# Altium project Side.PrjPcb
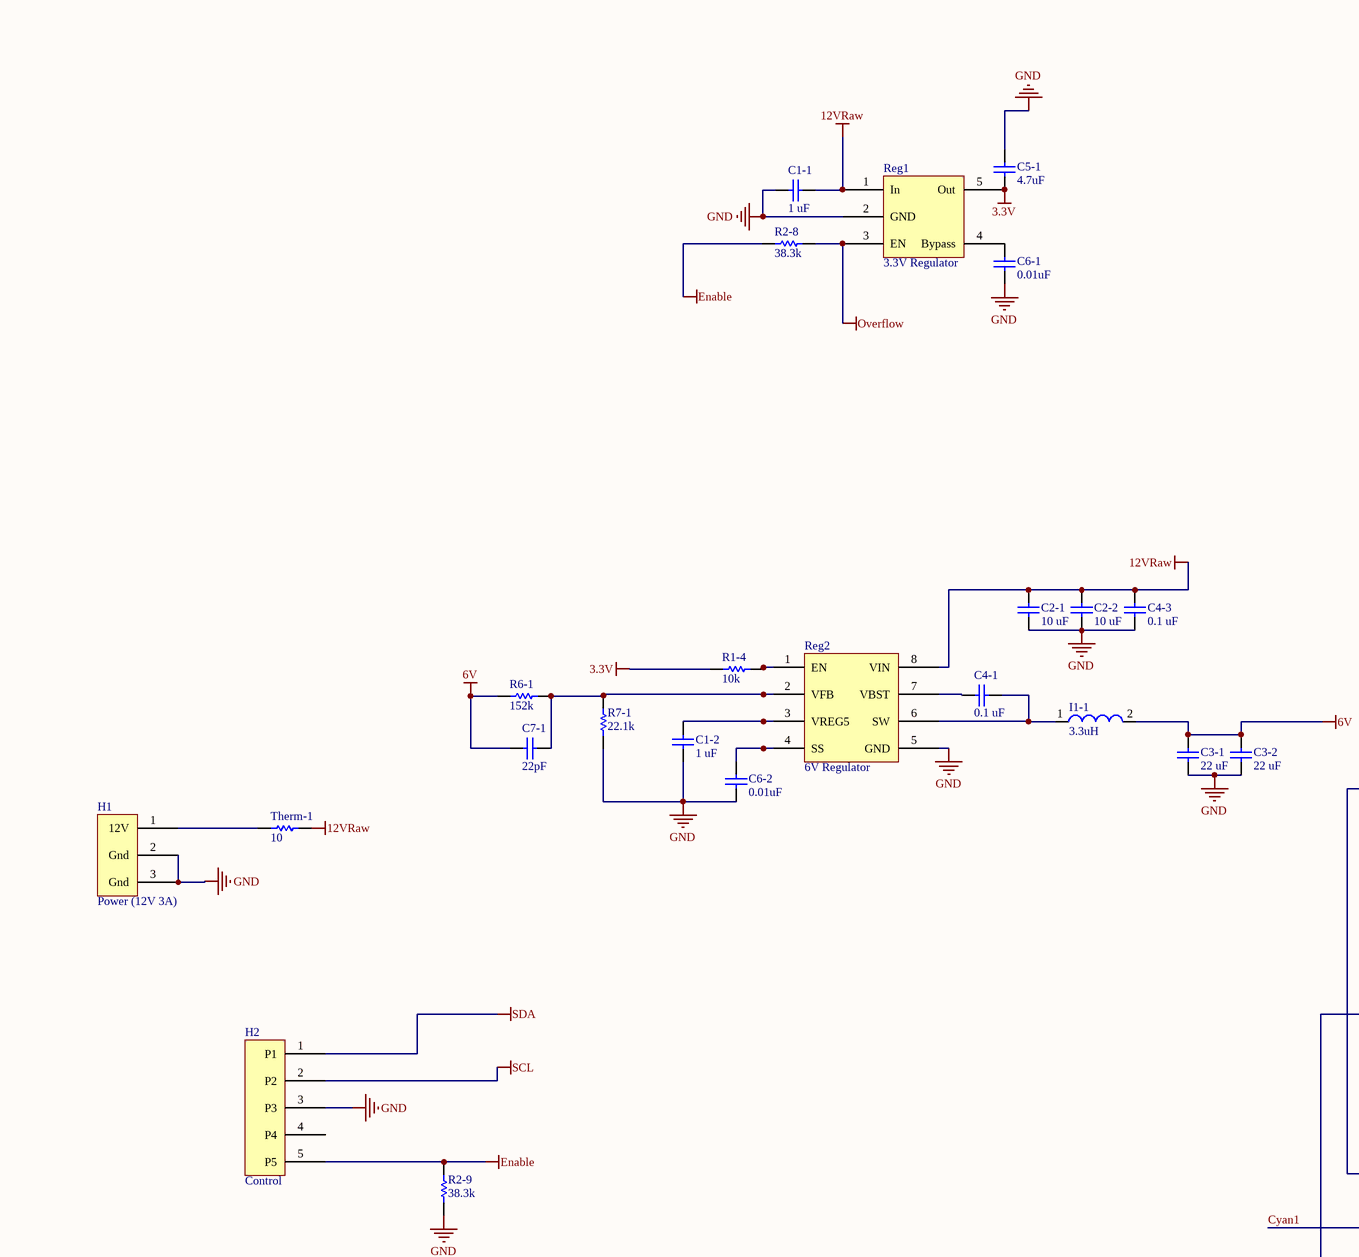
[diagram p0: Side.SchDoc, top left]
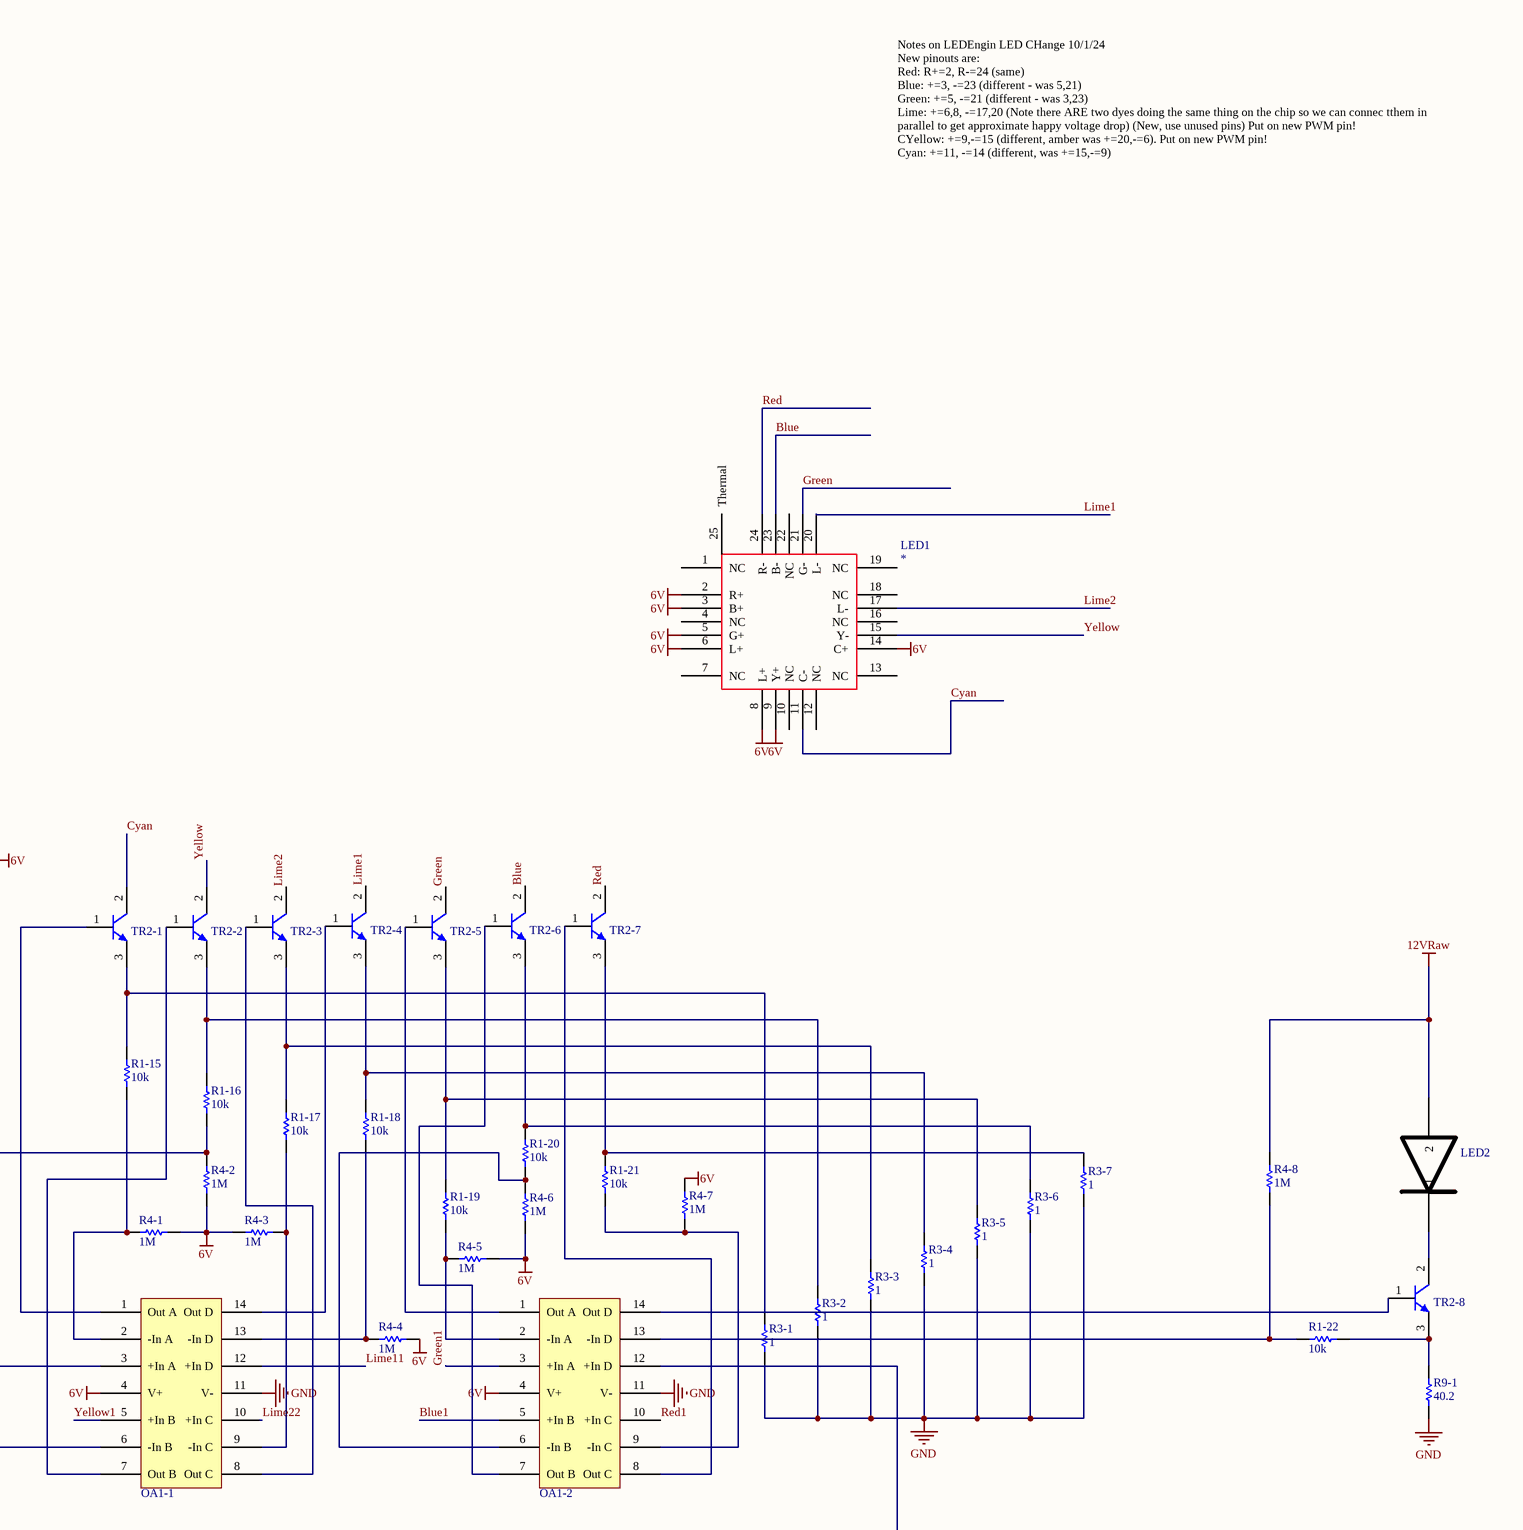
[diagram p1: Side.SchDoc, top right]
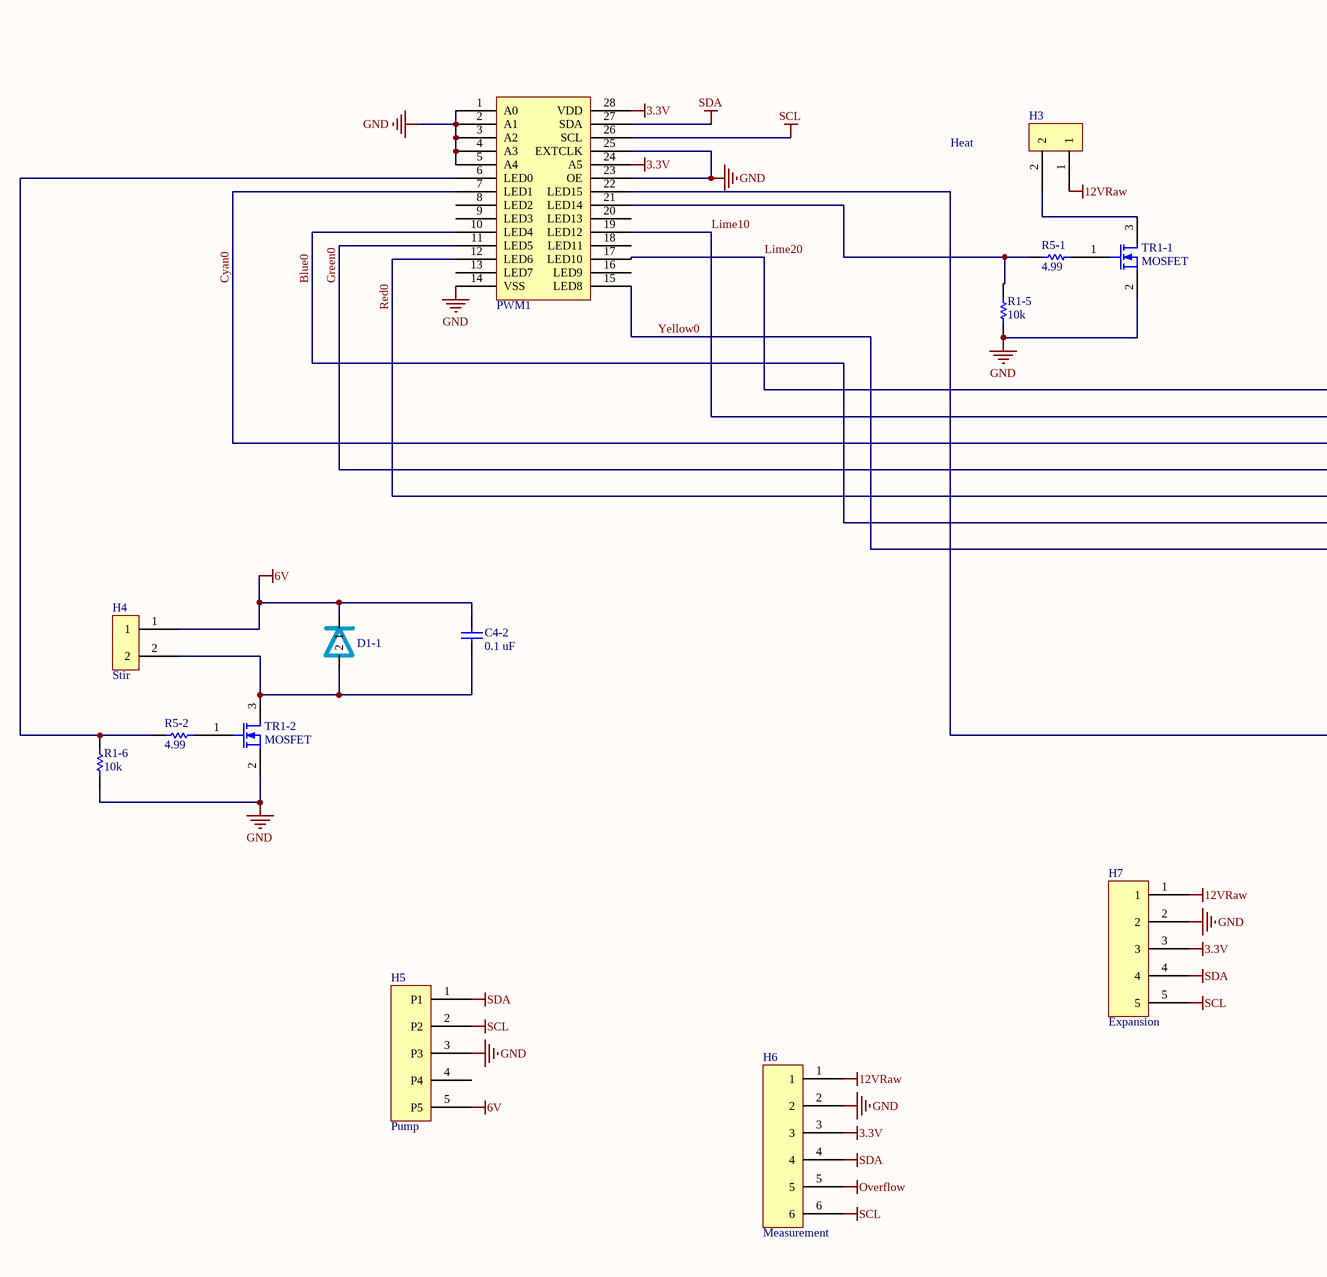
[diagram p2: Side.SchDoc, bottom left]
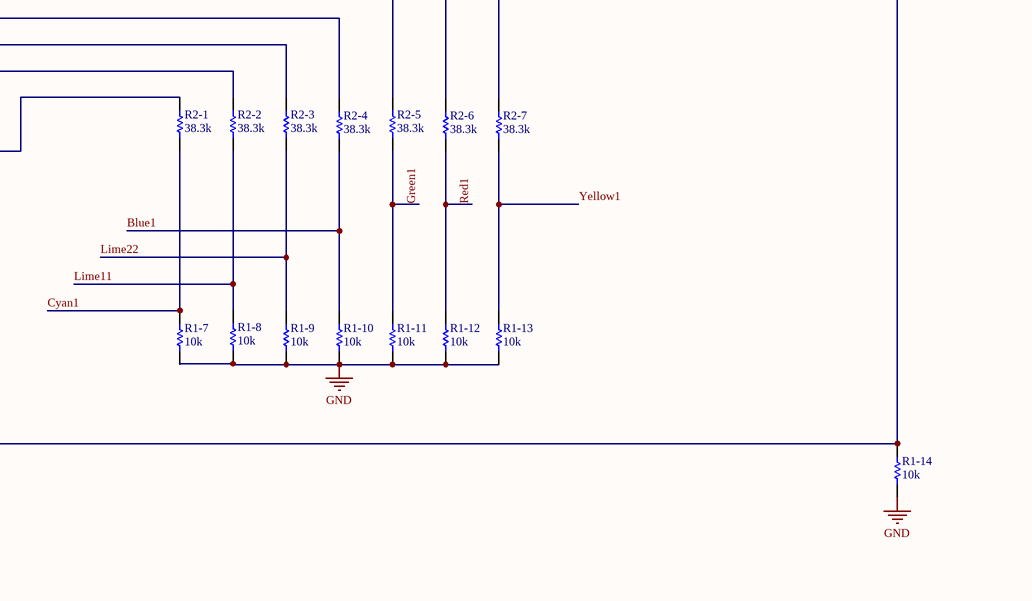
[diagram p3: Side.SchDoc, bottom right]
1 sheet, 88 parts. Net scope: global (net labels, ports and power ports of the same name join across sheets).
Board file: Side.PcbDoc

## Sheet Side.SchDoc
size A1

### Parts
C1-1  1 uF  [1608[0603]]
C1-2  1 uF  [1608[0603]]
C2-1  10 uF  [0805Large]
C2-2  10 uF  [0805Large]
C3-1  22 uF  [0805Large]
C3-2  22 uF  [0805Large]
C4-1  0.1 uF  [1608[0603]]
C4-2  0.1 uF  [1608[0603]]
C4-3  0.1 uF  [1608[0603]]
C5-1  4.7uF  [1608[0603]]
C6-1  0.01uF  [1608[0603]]
C6-2  0.01uF  [1608[0603]]
C7-1  22pF  [1608[0603]]
D1-1  D1  [SOD 123]  (value not drawn)
H1  Power (12V 3A)  [PowerJack1]
H2  Control  [Micro USB]
H3  Heat  [InterCon2]
H4  Stir  [InterCon2]
H5  Pump  [Micro USB]
H6  Measurement  [Inter Connect 6 - reduced]
H7  Expansion  [Inter Connect 5]
I1-1  3.3uH  [INDUCTOR2]
LED1  *  [LEDENGIN]
LED2  LED UV  [UV LED]  (value not drawn)
OA1-1  OpAmp 4Way  [SOIC14_M]  (value not drawn)
OA1-2  OpAmp 4Way  [SOIC14_M]  (value not drawn)
PWM1  PWM28  [TSSOP-28]  (value not drawn)
R1-4  10k  [1608[0603]]
R1-5  10k  [1608[0603]]
R1-6  10k  [1608[0603]]
R1-7  10k  [1608[0603]]
R1-8  10k  [1608[0603]]
R1-9  10k  [1608[0603]]
R1-10  10k  [1608[0603]]
R1-11  10k  [1608[0603]]
R1-12  10k  [1608[0603]]
R1-13  10k  [1608[0603]]
R1-14  10k  [1608[0603]]
R1-15  10k  [1608[0603]]
R1-16  10k  [1608[0603]]
R1-17  10k  [1608[0603]]
R1-18  10k  [1608[0603]]
R1-19  10k  [1608[0603]]
R1-20  10k  [1608[0603]]
R1-21  10k  [1608[0603]]
R1-22  10k  [1608[0603]]
R2-1  38.3k  [1608[0603]]
R2-2  38.3k  [1608[0603]]
R2-3  38.3k  [1608[0603]]
R2-4  38.3k  [1608[0603]]
R2-5  38.3k  [1608[0603]]
R2-6  38.3k  [1608[0603]]
R2-7  38.3k  [1608[0603]]
R2-8  38.3k  [1608[0603]]
R2-9  38.3k  [1608[0603]]
R3-1  1  [2512]
R3-2  1  [2512]
R3-3  1  [2512]
R3-4  1  [2512]
R3-5  1  [2512]
R3-6  1  [2512]
R3-7  1  [2512]
R4-1  1M  [1608[0603]]
R4-2  1M  [1608[0603]]
R4-3  1M  [1608[0603]]
R4-4  1M  [1608[0603]]
R4-5  1M  [1608[0603]]
R4-6  1M  [1608[0603]]
R4-7  1M  [1608[0603]]
R4-8  1M  [1608[0603]]
R5-1  4.99  [1608[0603]]
R5-2  4.99  [1608[0603]]
R6-1  152k  [1608[0603]]
R7-1  22.1k  [1608[0603]]
R9-1  40.2  [0805]
Reg1  3.3V Regulator  [SOT23-5]
Reg2  6V Regulator  [8-SOIC V3]
Therm-1  10  [1206]
TR1-1  MOSFET  [SOT23-3]
TR1-2  MOSFET  [SOT23-3]
TR2-1  TransistorPower2  [SOT223_M]  (value not drawn)
TR2-2  TransistorPower2  [SOT223_M]  (value not drawn)
TR2-3  TransistorPower2  [SOT223_M]  (value not drawn)
TR2-4  TransistorPower2  [SOT223_M]  (value not drawn)
TR2-5  TransistorPower2  [SOT223_M]  (value not drawn)
TR2-6  TransistorPower2  [SOT223_M]  (value not drawn)
TR2-7  TransistorPower2  [SOT223_M]  (value not drawn)
TR2-8  TransistorPower2  [SOT223_M]  (value not drawn)

### Nets
3.3V: C5-1.1 H6.3 H7.3 PWM1.24(A5) PWM1.28(VDD) R1-4.1 Reg1.5(Out)
6V: C3-1.2 C3-2.2 C4-2.1 C7-1.2 D1-1.1 H4.1 H5.5(P5) I1-1.2 LED1.2(R+) LED1.3(B+) LED1.5(G+) LED1.6(L+) LED1.8(L+) LED1.9(Y+) LED1.14(C+) OA1-1.4(V+) OA1-2.4(V+) R4-1.1 R4-2.1 R4-3.1 R4-4.1 R4-5.1 R4-6.1 R4-7.1 R6-1.1
12VRaw: C1-1.1 C2-1.2 C2-2.2 C4-3.1 H3.1 H6.1 H7.1 LED2.2 R4-8.1 Reg1.1(In) Reg2.8(VIN) Therm-1.2
Enable: H2.5(P5) R2-8.1 R2-9.2
GND: C1-1.2 C1-2.2 C2-1.1 C2-2.1 C3-1.1 C3-2.1 C4-3.2 C5-1.2 C6-1.1 C6-2.2 H1.2(Gnd) H1.3(Gnd) H2.3(P3) H5.3(P3) H6.2 H7.2 OA1-1.11(V-) OA1-2.11(V-) PWM1.1(A0) PWM1.2(A1) PWM1.3(A2) PWM1.4(A3) PWM1.5(A4) PWM1.14(VSS) PWM1.23(OE) PWM1.25(EXTCLK) R1-5.1 R1-6.1 R1-7.1 R1-8.1 R1-9.1 R1-10.1 R1-11.1 R1-12.1 R1-13.1 R1-14.1 R2-9.1 R3-1.1 R3-2.1 R3-3.1 R3-4.1 R3-5.1 R3-6.1 R3-7.1 R7-1.1 R9-1.1 Reg1.2(GND) Reg2.5(GND) TR1-1.2(S) TR1-2.2(S)
Overflow: H6.5 R2-8.2 Reg1.3(EN)
SCL: H2.2(P2) H5.2(P2) H6.6 H7.5 PWM1.26(SCL)
SDA: H2.1(P1) H5.1(P1) H6.4 H7.4 PWM1.27(SDA)
Blue: LED1.23(B-) TR2-6.2(C)
Blue0: PWM1.10(LED4) R2-4.2
Blue1: OA1-2.5(+In_B) R1-10.2 R2-4.1
Cyan: LED1.11(C-) TR2-1.2(C)
Cyan0: PWM1.7(LED1) R2-1.2
Cyan1: OA1-1.3(+In_A) R1-7.2 R2-1.1
Green: LED1.21(G-) TR2-5.2(C)
Green0: PWM1.11(LED5) R2-5.2
Green1: OA1-2.3(+In_A) R1-11.2 R2-5.1
Lime1: LED1.20(L-) TR2-4.2(C)
Lime2: LED1.17(L-) TR2-3.2(C)
Lime10: PWM1.19(LED12) R2-2.2
Lime11: OA1-1.12(+In_D) R1-8.2 R2-2.1
Lime20: PWM1.17(LED10) R2-3.2
Lime22: OA1-1.10(+In_C) R1-9.2 R2-3.1
Red: LED1.24(R-) TR2-7.2(C)
Red0: PWM1.12(LED6) R2-6.2
Red1: OA1-2.10(+In_C) R1-12.2 R2-6.1
Yellow: LED1.15(Y-) TR2-2.2(C)
Yellow0: PWM1.15(LED8) R2-7.2
Yellow1: OA1-1.5(+In_B) R1-13.2 R2-7.1
NetC1-2_1: C1-2.1 Reg2.3(VREG5)
NetC4-1_1: C4-1.1 I1-1.1 Reg2.6(SW)
NetC4-1_2: C4-1.2 Reg2.7(VBST)
NetC4-2_2: C4-2.2 D1-1.2 H4.2 TR1-2.3(D)
NetC6-1_2: C6-1.2 Reg1.4(Bypass)
NetC6-2_1: C6-2.1 Reg2.4(SS)
NetC7-1_1: C7-1.1 R6-1.2 R7-1.2 Reg2.2(VFB)
NetH1_1: H1.1(12V) Therm-1.1
NetH3_2: H3.2 TR1-1.3(D)
NetLED2_1: LED2.1 TR2-8.2(C)
NetOA1-1_1: OA1-1.1(Out_A) TR2-1.1(B)
NetOA1-1_2: OA1-1.2(-In_A) R1-15.1 R4-1.2
NetOA1-1_6: OA1-1.6(-In_B) R1-16.1 R4-2.2
NetOA1-1_7: OA1-1.7(Out_B) TR2-2.1(B)
NetOA1-1_8: OA1-1.8(Out_C) TR2-3.1(B)
NetOA1-1_9: OA1-1.9(-In_C) R1-17.1 R4-3.2
NetOA1-1_13: OA1-1.13(-In_D) R1-18.1 R4-4.2
NetOA1-1_14: OA1-1.14(Out_D) TR2-4.1(B)
NetOA1-2_1: OA1-2.1(Out_A) TR2-5.1(B)
NetOA1-2_2: OA1-2.2(-In_A) R1-19.1 R4-5.2
NetOA1-2_6: OA1-2.6(-In_B) R1-20.1 R4-6.2
NetOA1-2_7: OA1-2.7(Out_B) TR2-6.1(B)
NetOA1-2_8: OA1-2.8(Out_C) TR2-7.1(B)
NetOA1-2_9: OA1-2.9(-In_C) R1-21.1 R4-7.2
NetOA1-2_12: OA1-2.12(+In_D) PWM1.22(LED15) R1-14.2
NetOA1-2_13: OA1-2.13(-In_D) R1-22.2 R4-8.2
NetOA1-2_14: OA1-2.14(Out_D) TR2-8.1(B)
NetPWM1_6: PWM1.6(LED0) R1-6.2 R5-2.1
NetPWM1_21: PWM1.21(LED14) R1-5.2 R5-1.1
NetR1-4_2: R1-4.2 Reg2.1(EN)
NetR1-15_2: R1-15.2 R3-1.2 TR2-1.3(E)
NetR1-16_2: R1-16.2 R3-2.2 TR2-2.3(E)
NetR1-17_2: R1-17.2 R3-3.2 TR2-3.3(E)
NetR1-18_2: R1-18.2 R3-4.2 TR2-4.3(E)
NetR1-19_2: R1-19.2 R3-5.2 TR2-5.3(E)
NetR1-20_2: R1-20.2 R3-6.2 TR2-6.3(E)
NetR1-21_2: R1-21.2 R3-7.2 TR2-7.3(E)
NetR1-22_1: R1-22.1 R9-1.2 TR2-8.3(E)
NetR5-1_2: R5-1.2 TR1-1.1(G)
NetR5-2_2: R5-2.2 TR1-2.1(G)

Not connected (* = marked no-connect by the designer): H2 4(P4); H5 4(P4); LED1 1(NC) 4(NC) 7(NC) 10(NC) 12(NC) 13(NC) 16(NC) 18(NC) 19(NC) 22(NC) 25(Thermal); PWM1 8(LED2) 9(LED3) 13(LED7) 16(LED9) 18(LED11) 20(LED13)

### Notes on the sheet
- Notes on LEDEngin LED CHange 10/1/24
  New pinouts are:
  Red: R+=2, R-=24 (same)
  Blue: +=3, -=23 (different - was 5,21)
  Green: +=5, -=21 (different - was 3,23)
  Lime: +=6,8, -=17,20 (Note there ARE two dyes doing the same thing on the chip so we can connec tthem in parallel to get approximate happy voltage drop) (New, use unused pins) Put on new PWM pin!
  CYellow: +=9,-=15 (different, amber was +=20,-=6). Put on new PWM pin!
  Cyan: +=11, -=14 (different, was +=15,-=9)

### Library data of the parts
C1-1 C1-2 C4-1-C4-3 C5-1 C6-1 C6-2 = Cap: Capacitor; FP: 0603 (1608 Metric)
  C1-1 C1-2: Digikey P/N: 1276-1019-1-ND
  C4-1-C4-3: Digikey P/N: 311-1341-1-ND
  C5-1: Digikey P/N: 1276-1044-1-ND
  C6-1 C6-2: Digikey P/N: 445-5662-1-ND
C2-1 C2-2 C3-1 C3-2 = Cap 0805: Capacitor; FP: 0805 (2012 Metric)
  C2-1 C2-2: Digikey P/N: 587-1295-1-ND
  C3-1 C3-2: Digikey P/N: 1276-6780-1-ND
C7-1 = Cap: Capacitor C0G,NP0; FP: 0603 (1608 Metric); Digikey P/N: 311-1755-1-ND
D1-1 = Diode: FP: SOD-123; DigiKey: https://www.digikey.co.uk/products/en?keywords=1655-1928-1-ND; Digikey P/N: 1655-1928-1-ND
H1 = PowerJack1: Power Connector; FP: PWR Jack; Digikey: https://www.digikey.co.uk/product-detail/en/cui-inc/PJ-044AH/CP-044AH-ND/1644569; Digikey P/N: CP-044AH-ND
H2 H5 = MicroUSB: MicroUSB Connector; FP: MicroUSB Female; DK: https://www.digikey.co.uk/product-detail/en/molex-llc/1051330001/WM9734CT-ND/4037910; Digikey P/N: WM10134CT-ND
H3 H4 = Interconnect 2: 2 Position Connector; FP: Mini CT 2POS; DK: https://www.digikey.co.uk/product-detail/en/te-connectivity-amp-connectors/292207-2/A98681-ND/1855351; Digikey P/N: A98681-ND
H6 = Interconnect 6: 6 Wire; FP: Connecting Wire; DK: https://www.digikey.co.uk/product-detail/en/te-connectivity-amp-connectors/292207-6/A98685-ND/1855355; Digikey P/N: A100196-ND
H7 = Interconnect 5: 5 Position Connector; FP: Mini CT 5POS; DK: https://www.digikey.co.uk/product-detail/en/te-connectivity-amp-connectors/292207-5/A98684-ND/1855354; Digikey P/N: A98684-ND
I1-1 = Inductor2: Inductor; FP: Wirewound Inductor; DK: https://www.digikey.co.uk/product-detail/en/tdk-corporation/SPM6530T-3R3M/445-4119-1-ND/1993657; Digikey P/N: 445-4119-1-ND
LED1 = LEDEngin_V2: Digikey P/N: LZ7-04M2PD-0000_G2
LED2 = LED UV: FP: XR SMD; DigiKey: https://www.digikey.co.uk/products/en?keywords=RVXR-280-SM-073105; Digikey P/N: 1807-1023-2-ND
OA1-1 OA1-2 = OpAmp 4Way: OpAmp; FP: 14-SOIC; DK: https://www.digikey.co.uk/product-detail/en/analog-devices-inc/AD8534ARZ-REEL/AD8534ARZ-REELCT-ND/3771270; Digikey P/N: AD8534ARZ-REELCT-ND
PWM1 = PWM28: PWM; FP: 28-TSSOP; Dk: https://www.digikey.co.uk/product-detail/en/nxp-usa-inc/PCA9685PW118/568-11925-1-ND/5221902; Digikey P/N: 568-11925-1-ND
R1-4-R1-22 R2-1-R2-9 R4-1-R4-8 R5-1 R5-2 R6-1 R7-1 = Res1: Resistor; FP: 0603 (1608 Metric)
  R1-4-R1-22: Digikey P/N: 311-10.0KHRCT-ND
  R2-1-R2-9: Digikey P/N: 311-38.3KHRCT-ND
  R4-1-R4-8: Digikey P/N: RMCF0603FG1M00CT-ND
  R5-1 R5-2: Digikey P/N: 311-4.99HRCT-ND
  R6-1: Digikey: https://www.digikey.co.uk/product-detail/en/yageo/RT0603DRE07152KL/311-2096-1-ND/6128515; Digikey P/N: 311-2096-1-ND
  R7-1: Digikey P/N: 311-2486-1-ND
R3-1-R3-7 = Res2: Resistor; FP: 2512 (6432 Metric); Digikey P/N: A109718CT-ND
R9-1 = Res2: Resistor; FP: 0805 (2012 Metric); Digikey: https://www.digikey.co.uk/product-detail/en/stackpole-electronics-inc/RMCF2512FT49R9/RMCF2512FT49R9CT-ND/6052990; Digikey P/N: P16072CT-ND
Reg1 = 4V Regulator: FP: SOT-23-5; Digikey: https://www.digikey.co.uk/product-detail/en/texas-instruments/LP2985-33DBVR/296-18476-1-ND/809911; Digikey P/N: 296-18476-1-ND
Reg2 = VRegulator V2: FP: 8-SOIC; Digikey: https://www.digikey.co.uk/product-detail/en/texas-instruments/TPS54427DDAR/296-30033-1-ND/2795678; Digikey P/N: 296-30033-1-ND
Therm-1 = Res1: Thermistor; FP: 1206 (3216 Metric); Digikey: https://www.digikey.com/en/products/detail/NC20KC0100KBA/478-NC20KC0100KBACT-ND/12760761; Digikey P/N: 478-NC20KC0100KBACT-ND
TR1-1 TR1-2 = Heater MOSFET: Transistor; FP: SOT-23-3; Digikey: https://www.digikey.co.uk/product-detail/en/alpha-omega-semiconductor-inc/AO3420/785-1014-1-ND/1855956; Digikey P/N: 785-1014-1-ND
TR2-1-TR2-8 = TransistorPower2: Transistor; FP: SOT-223; DigiKey: https://www.digikey.co.uk/product-detail/en/diodes-incorporated/ZXTN25100DGTA/ZXTN25100DGCT-ND/1873984; Digikey P/N: ZXTN25100DGCT-ND